# Altium schematic sheet FPGA_board_conn_pt2.SchDoc: JM2 TE0720 carrier connector
size A4; DocumentNumber: ADC-SCH-15; SheetNumber: 15; SheetTotal: 20
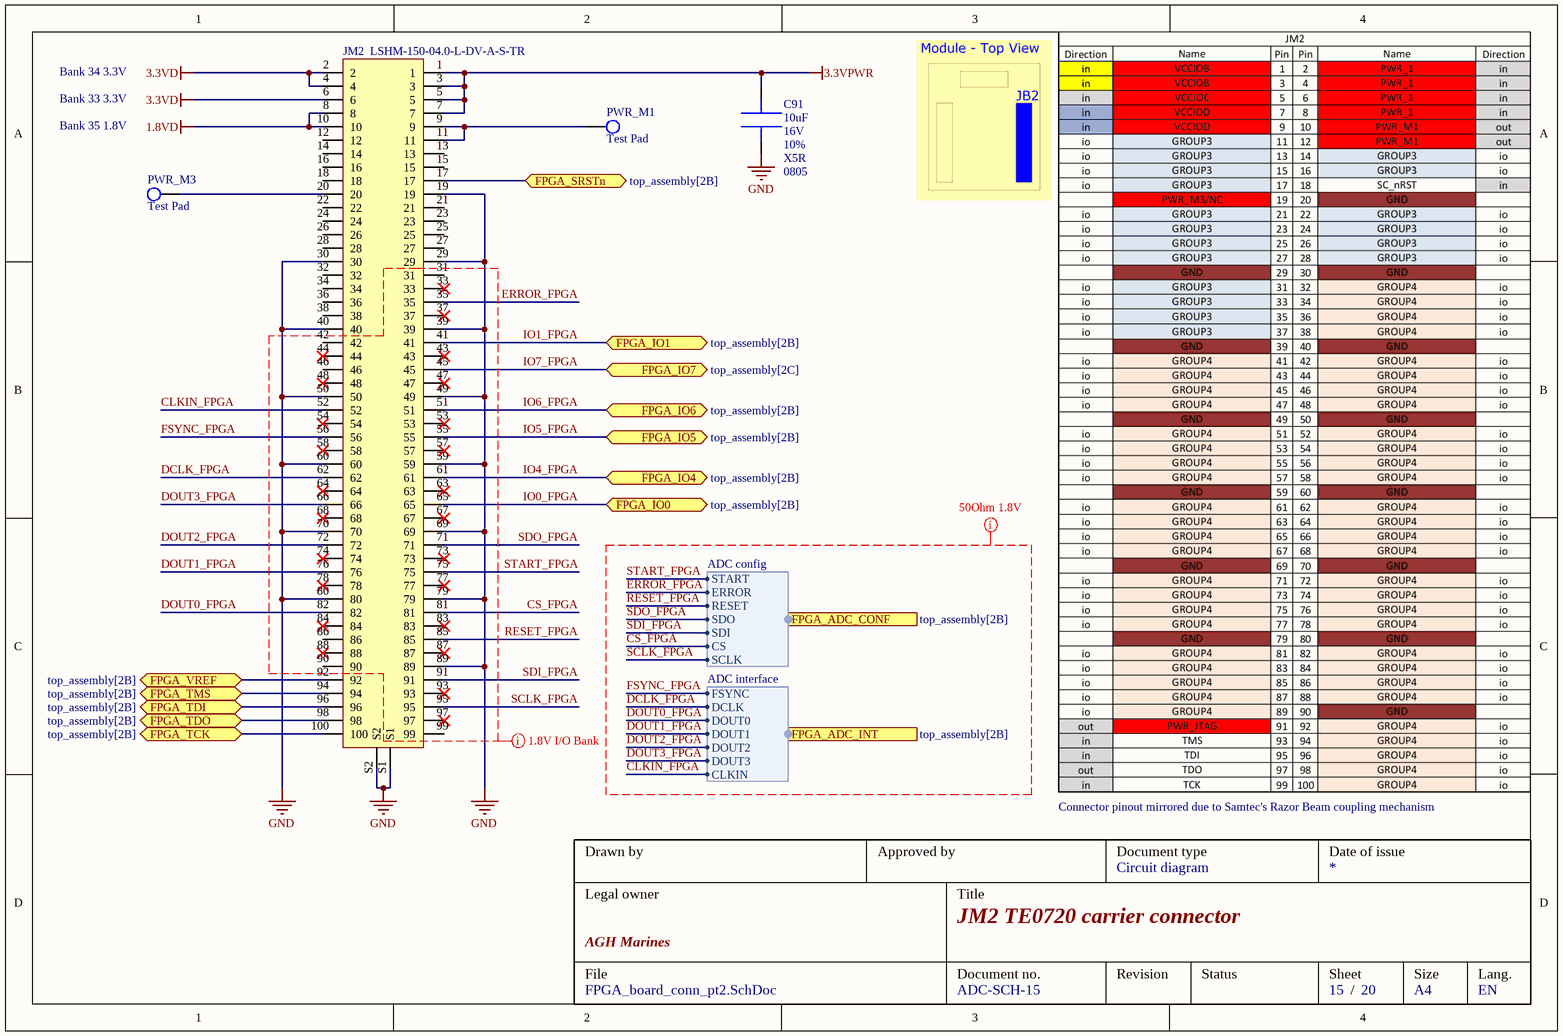
[diagram p0: FPGA_board_conn_pt2.SchDoc]

## Parts
C91  value 10uF  Voltage: 16V  Tolerance: 10%  Dielectric: X5R  Package: 0805  [CAPC_0805]  (hidden comment: EMK212BJ106KG-T)
JM2  LSHM-150-04.0-L-DV-A-S-TR  [CONS_LSHM-150-04.0-L-DV-A-S-TR]
PWR_M1  Test Pad  [TP_1mm]
PWR_M3  Test Pad  [TP_1mm]

## Ports
FPGA_ADC_CONF (harness ADC config, see top_assembly[2B]), FPGA_ADC_INT (harness ADC interface, see top_assembly[2B]), FPGA_IO0 (bidir, see top_assembly[2B]), FPGA_IO1 (bidir, see top_assembly[2B]), FPGA_IO4 (bidir, see top_assembly[2B]), FPGA_IO5 (bidir, see top_assembly[2B]), FPGA_IO6 (bidir, see top_assembly[2B]), FPGA_IO7 (bidir, see top_assembly[2C]), FPGA_SRSTn (bidir, see top_assembly[2B]), FPGA_TCK (bidir, see top_assembly[2B]), FPGA_TDI (bidir, see top_assembly[2B]), FPGA_TDO (bidir, see top_assembly[2B]), FPGA_TMS (bidir, see top_assembly[2B]), FPGA_VREF (bidir, see top_assembly[2B])

## Harnesses
ADC interface: FSYNC, DCLK, DOUT0, DOUT1, DOUT2, DOUT3, CLKIN
ADC config: START, ERROR, RESET, SDO, SDI, CS, SCLK

## Nets
1.8VD: JM2.8 JM2.10
3.3VD: JM2.2 JM2.4 JM2.6
3.3VPWR: C91.2 JM2.1 JM2.3 JM2.5 JM2.7
GND: C91.1 JM2.19 JM2.29 JM2.30 JM2.39 JM2.40 JM2.49 JM2.50 JM2.59 JM2.60 JM2.69 JM2.70 JM2.79 JM2.80 JM2.89 JM2.S1 JM2.S2
CLKIN_FPGA: JM2.52 ; port FPGA_ADC_INT.CLKIN
CS_FPGA: JM2.81 ; port FPGA_ADC_CONF.CS
DCLK_FPGA: JM2.62 ; port FPGA_ADC_INT.DCLK
DOUT0_FPGA: JM2.82 ; port FPGA_ADC_INT.DOUT0
DOUT1_FPGA: JM2.76 ; port FPGA_ADC_INT.DOUT1
DOUT2_FPGA: JM2.72 ; port FPGA_ADC_INT.DOUT2
DOUT3_FPGA: JM2.66 ; port FPGA_ADC_INT.DOUT3
ERROR_FPGA: JM2.35 ; port FPGA_ADC_CONF.ERROR
FPGA_SRSTn: JM2.17 ; port FPGA_SRSTn
FPGA_TCK: JM2.100 ; port FPGA_TCK
FPGA_TDI: JM2.96 ; port FPGA_TDI
FPGA_TDO: JM2.98 ; port FPGA_TDO
FPGA_TMS: JM2.94 ; port FPGA_TMS
FPGA_VREF: JM2.92 ; port FPGA_VREF
FSYNC_FPGA: JM2.56 ; port FPGA_ADC_INT.FSYNC
IO0_FPGA: JM2.65 ; port FPGA_IO0
IO1_FPGA: JM2.41 ; port FPGA_IO1
IO4_FPGA: JM2.61 ; port FPGA_IO4
IO5_FPGA: JM2.55 ; port FPGA_IO5
IO6_FPGA: JM2.51 ; port FPGA_IO6
IO7_FPGA: JM2.45 ; port FPGA_IO7
RESET_FPGA: JM2.85 ; port FPGA_ADC_CONF.RESET
SCLK_FPGA: JM2.95 ; port FPGA_ADC_CONF.SCLK
SDI_FPGA: JM2.91 ; port FPGA_ADC_CONF.SDI
SDO_FPGA: JM2.71 ; port FPGA_ADC_CONF.SDO
START_FPGA: JM2.75 ; port FPGA_ADC_CONF.START
NetJM2_9: JM2.9 JM2.11 PWR_M1.1
NetJM2_20: JM2.20 PWR_M3.1

Not connected (* = marked no-connect by the designer): JM2 12 13 14 15 16 18 21 22 23 24 25 26 27 28 31 32 33* 34 36 37* 38 42 43* 44* 46 47* 48* 53* 54* 57* 58* 63* 64* 67* 68* 73* 74* 77* 78* 83* 84* 86 87* 88* 90 93* 97* 99

## Layout directives
net class 50OhmSingle: (no net found under the mark), CLKIN_FPGA, CS_FPGA, DCLK_FPGA, DOUT0_FPGA, DOUT1_FPGA, DOUT2_FPGA, DOUT3_FPGA, ERROR_FPGA, FSYNC_FPGA, RESET_FPGA, SCLK_FPGA, SDI_FPGA, SDO_FPGA, START_FPGA

## Notes on the sheet
- Bank 34 3.3V
- Bank 33 3.3V
- Bank 35 1.8V
- Connector pinout mirrored due to Samtec's Razor Beam coupling mechanism
- Drawn by
- Approved by
- Document type
- Date of issue
- Legal owner
- Title
- Circuit diagram
- File
- AGH Marines
- Document no.
- Revision
- Status
- Sheet
- Size
- Lang.
- /
- A4
- EN

## Library data of the parts
C91 = EMK212BJ106KG-T: Multilayer Ceramic Capacitors MLCC - SMD/SMT 16V 10uF X5R 0805 10 %; Manufacturer: TAIYO YUDEN; Supplier 1: Mouser; Supplier Part Number 1: 963-EMK212BJ106KG-T
JM2 = LSHM-150-04.0-L-DV-A-S-TR: Board to Board & Mezzanine Connectors 0.50 mm Razor Beam(TM) High-Speed Hermaphroditic Terminal/Socket Strip; Manufacturer: Samtec; Supplier 1: Mouser; Supplier Part Number 1: 200-LSHM15004.0LDVAS; ClassName: FPGA_Socket